# Altium schematic sheet stm32‑smart‑charger.SchDoc
size 330 x 193 mm
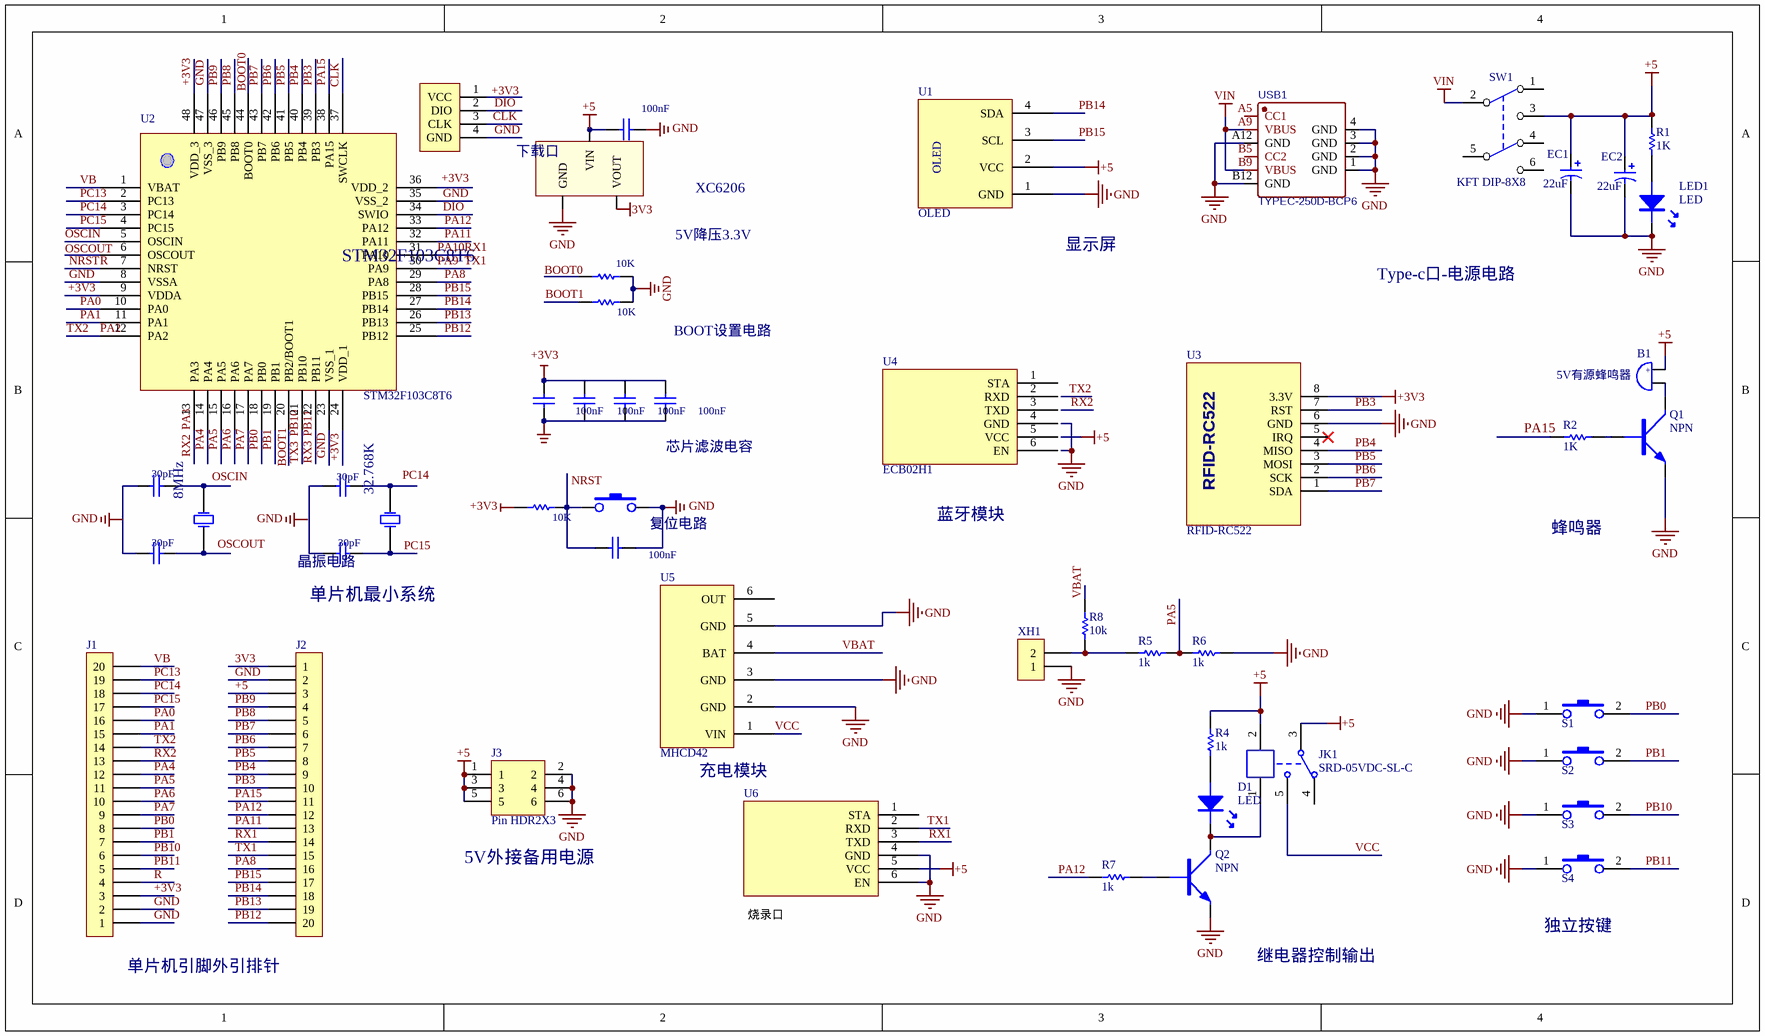
[diagram p0: stm32‑smart‑charger.SchDoc]

## Parts
B1  5V有源蜂鸣器  [BEEP 7.6X12X7.5]
D1  LED  [LED5-BLUE]
EC1  22uF  [DIP-EC2.5X5X11]
EC2  22uF  [DIP-EC2.5X5X11]
J1  (no value)  [Pin HDR1X20/2.54mm-S]
J2  (no value)  [Pin HDR1X20/2.54mm-S]
J3  Pin HDR2X3  [Pin HDR2X3/2.54mm-S]
JK1  SRD-05VDC-SL-C  [SRD-C_B]
LED1  LED  [LED5-BLUE]
Q1  NPN  [TO-92A]
Q2  NPN  [TO-92A]
R1  1K  [AXIAL0.3]
R2  1K  [AXIAL0.3]
R4  1k  [AXIAL0.3]
R5  1k  [AXIAL0.3]
R6  1k  [AXIAL0.3]
R7  1k  [AXIAL0.3]
R8  10k  [AXIAL0.3]
S1  BUTTOM  [DIP-6X6X5]  (value not drawn)
S2  BUTTOM  [DIP-6X6X5]  (value not drawn)
S3  BUTTOM  [DIP-6X6X5]  (value not drawn)
S4  BUTTOM  [DIP-6X6X5]  (value not drawn)
SW1  KFT DIP-8X8  [KFT DIP-8X8]
U1  OLED  [1*4PIN/2.54mm（G,V,S,S）]
U2  STM32F103C8T6  [STM32F103C8T6]
U3  RFID-RC522  [RFID-RC522]
U4  ECB02H1  [ECB02]
U5  MHCD42  [1*6PIN/2.54mm(V,G,G,B,G,O)]
U6  (no value)  [1*6PIN/2.54mm（S,R,T,G,V,E）]
USB1  TYPEC-250D-BCP6  [USB-C-SMD_TYPEC-250D-BCP6]
XH1  (no value)  [XH2/2.54mm/180]

## Nets
3V3: J2.1 U2.52(VOUT)
+3V3: J1.3 U2.48(VDD_3) U3.8(3.3V)
+5: B1.1 EC1.1 EC2.1 J2.3 J3.1 J3.3 J3.5 JK1.2 JK1.3 R1.2 R4.2 SW1.3 U1.2(VCC) U2.50(VIN) U6.5(VCC)
GND: EC1.2 EC2.2 J1.1 J1.2 J2.2 J3.2 J3.4 J3.6 LED1.K Q1.E Q2.E R6.1 S1.1 S2.1 S3.1 S4.1 U1.1(GND) U2.47(VSS_3) U2.51(GND) U3.6(GND) U5.2(GND) U5.3(GND) U5.5(GND) U6.4(GND) U6.6(EN) USB1.1(GND) USB1.2(GND) USB1.3(GND) USB1.4(GND) USB1.A12(GND) USB1.B12(GND) XH1.1
VIN: SW1.2 USB1.A9(VBUS) USB1.B9(VBUS)
PA0: J1.16 U2.10(PA0)
PA1: J1.15 U2.11(PA1)
PA2: J1.14 U2.12(PA2)  [also labelled TX2]
PA3: J1.13 U2.13(PA3)  [also labelled RX2]
PA4: J1.12 U2.14(PA4)
PA5: J1.11 R5.1 R6.2 U2.15(PA5)
PA6: J1.10 U2.16(PA6)
PA7: J1.9 U2.17(PA7)
PA8: J2.16 U2.29(PA8)
PA9: J2.15 U2.30(PA9) U6.2(RXD)  [also labelled TX1]
PA10: J2.14 U2.31(PA10) U6.3(TXD)  [also labelled RX1]
PA11: J2.13 U2.32(PA11)
PA12: J2.12 R7.2 U2.33(PA12)
PA15: J2.11 R2.1 U2.38(PA15)
PB0: J1.8 S1.2 U2.18(PB0)
PB1: J1.7 S2.2 U2.19(PB1)
PB3: J2.10 U2.39(PB3) U3.7(RST)
PB4: J2.9 U2.40(PB4) U3.4(MISO)
PB5: J2.8 U2.41(PB5) U3.3(MOSI)
PB6: J2.7 U2.42(PB6) U3.2(SCK)
PB7: J2.6 U2.43(PB7) U3.1(SDA)
PB8: J2.5 U2.45(PB8)
PB9: J2.4 U2.46(PB9)
PB10: J1.6 S3.2 U2.21(PB10)  [also labelled TX3]
PB11: J1.5 S4.2 U2.22(PB11)  [also labelled RX3]
PB12: J2.20 U2.25(PB12)
PB13: J2.19 U2.26(PB13)
PB14: J2.18 U1.4(SDA) U2.27(PB14)
PB15: J2.17 U1.3(SCL) U2.28(PB15)
PC13: J1.19 U2.2(PC13)
PC14: J1.18 U2.3(PC14)
PC15: J1.17 U2.4(PC15)
R: J1.4 U2.7(NRST)
VB: J1.20 U2.1(VBAT)
VBAT: R8.1 U5.4(BAT)
VCC: JK1.5 U5.1(VIN)
NetB1_2: B1.2 Q1.C
NetD1_A: D1.A R4.1
NetD1_K: D1.K JK1.1 Q2.C
NetLED1_A: LED1.A R1.1
NetQ1_B: Q1.B R2.2
NetQ2_B: Q2.B R7.1
NetR5_2: R5.2 R8.2 XH1.2

Not connected (* = marked no-connect by the designer): JK1 4; SW1 1 4 5 6; U2 5(OSCIN) 6(OSCOUT) 8(VSSA) 9(VDDA) 20(PB2/BOOT1) 23(VSS_1) 24(VDD_1) 34(SWIO) 35(VSS_2) 36(VDD_2) 37(SWCLK) 44(BOOT0) ?1(OSC1) ?2(OSC2) ?3(OSC1) ?4(OSC2) ?5(1) ?6(2) ?7(2) ?8(1) ?9 ?10(2) a(2) b(2) c(1) d(1) e(2) f(2) g(1) h(1) q(2) s(1) w(1); U3 5(IRQ)*; U4 1(STA) 2(RXD) 3(TXD) 4(GND) 5(VCC) 6(EN); U5 6(OUT); U6 1(STA); USB1 A5(CC1) B5(CC2)

## Notes on the sheet
- (near U1) 显示屏
- Type-c口-电源电路
- 蓝牙模块
- 蜂鸣器
- (near U2) 单片机最小系统
- (near U5) 充电模块
- (near J3) 5V外接备用电源
- 烧录口
- (near J1) 单片机引脚外引排针
- 继电器控制输出
- (near S4) 独立按键
- (in symbol BEEP 5x9x5.5) +
- (in symbol STM32F103C8T6) +3V3; 100nF; 下载口; XC6206; 5V降压3.3V; 10K; BOOT1; BOOT设置电路; 芯片滤波电容; 30pF; 8MHz; 32.768K; 复位电路; 晶振电路

## Library data of the parts
B1 = BEEP 5x9x5.5: 蜂鸣器; 链接: https://www.mcude.com/edu/2763/
EC1 EC2 = CAP_EC: 极性电容
J1 J2 = Pin HDR1X20
J3 = Pin HDR2X3: 5V外界备用电源
JK1 = SRD-05VDC-SL-C: 5V一组转换
LED1 = LED: 发光二极管
Q1 Q2 = NPN: NPN三极管
R1 R2 = RES: 金属膜电阻
R4-R8 = RES
S1-S4 = BUTTOM: 按键
SW1 = KFT DIP-8X8: 蓝白自锁开关
U1 = 1*4PIN（G,V,S,S）: OLED显示屏; 链接: https://www.mcude.com/edu/2976/
U2 = STM32F103C8T6: STM32最小系统板; 链接: https://www.mcude.com/edu/mcuruan/3835/
U3 = RFID-RC522: RFID自动识别模块; 链接: https://www.mcude.com/edu/3805/
U4 = 1*6PIN(蓝牙): 蓝牙通信模块; 蓝牙: https://www.mcude.com/edu/2994/
U5 = 1*6PIN(V,G,G,B,G,O): 充电模块; 链接: https://www.mcude.com/edu/4605/
U6 = 1*6PIN（语音识别）: 智能语音识别模块; 链接: https://www.mcude.com/edu/4562/
USB1 = TYPEC-250D-BCP6: Type-c 接口; BOM_Manufacturer: XUNPU; Contributor: LCSC; BOM_Supplier: LCSC; BOM_Supplier Part: C720626; BOM_Manufacturer Part: TYPEC-250D-BCP6; BOM_JLCPCB Part Class: Extended Part; spicePre: U; spiceSymbolName: TYPEC-250D-BCP6; 链接: https://www.mcude.com/edu/6655/
XH1 = XH2